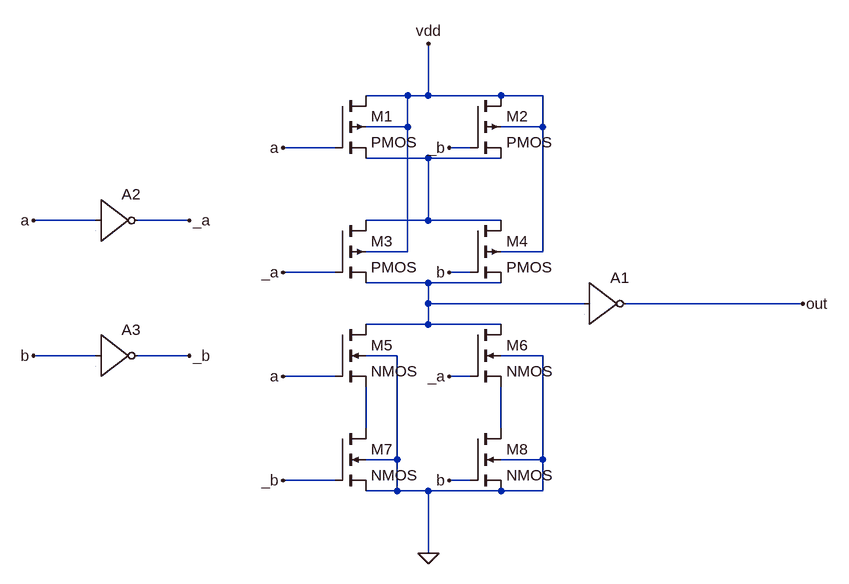
[diagram p0: schematic cmos_2input_xor_gate.asc]
cmos_2input_xor_gate.asc, the LTspice schematic file:
Version 4
SHEET 1 880 868
WIRE 192 112 128 112
WIRE 224 112 224 32
WIRE 224 112 192 112
WIRE 336 112 224 112
WIRE 400 112 336 112
WIRE 192 160 192 112
WIRE 192 160 128 160
WIRE 400 160 400 112
WIRE 400 160 336 160
WIRE 80 192 0 192
WIRE 288 192 256 192
WIRE 224 208 128 208
WIRE 336 208 224 208
WIRE -288 304 -384 304
WIRE -144 304 -224 304
WIRE 224 304 224 208
WIRE 224 304 128 304
WIRE 336 304 224 304
WIRE 192 352 192 160
WIRE 192 352 128 352
WIRE 400 352 400 160
WIRE 400 352 336 352
WIRE 80 384 0 384
WIRE 288 384 256 384
WIRE 224 400 128 400
WIRE 336 400 224 400
WIRE 224 432 224 400
WIRE 464 432 224 432
WIRE 800 432 528 432
WIRE 224 464 224 432
WIRE 224 464 128 464
WIRE 336 464 224 464
WIRE -288 512 -384 512
WIRE -144 512 -224 512
WIRE 176 512 128 512
WIRE 400 512 336 512
WIRE 80 544 0 544
WIRE 288 544 256 544
WIRE 128 624 128 560
WIRE 336 624 336 560
WIRE 176 672 176 512
WIRE 176 672 128 672
WIRE 400 672 400 512
WIRE 400 672 336 672
WIRE 80 704 0 704
WIRE 288 704 256 704
WIRE 176 720 176 672
WIRE 176 720 128 720
WIRE 224 720 176 720
WIRE 336 720 224 720
WIRE 400 720 400 672
WIRE 400 720 336 720
WIRE 224 816 224 720
FLAG 224 32 vdd
FLAG -384 304 a
FLAG -384 512 b
FLAG -144 304 _a
FLAG -144 512 _b
FLAG 0 192 a
FLAG 0 384 _a
FLAG 0 544 a
FLAG 256 544 _a
FLAG 0 704 _b
FLAG 256 704 b
FLAG 256 384 b
FLAG 256 192 _b
FLAG 224 816 0
FLAG 800 432 out
SYMBOL pmos4 80 112 R0
SYMATTR InstName M1
SYMBOL pmos4 288 112 R0
SYMATTR InstName M2
SYMBOL pmos4 80 304 R0
SYMATTR InstName M3
SYMBOL pmos4 288 304 R0
SYMATTR InstName M4
SYMBOL nmos4 80 464 R0
SYMATTR InstName M5
SYMBOL nmos4 288 464 R0
SYMATTR InstName M6
SYMBOL nmos4 80 624 R0
SYMATTR InstName M7
SYMBOL nmos4 288 624 R0
SYMATTR InstName M8
SYMBOL Digital\\inv 464 368 R0
SYMATTR InstName A1
SYMBOL Digital\\inv -288 240 R0
SYMATTR InstName A2
SYMBOL Digital\\inv -288 448 R0
SYMATTR InstName A3

The netlist it stands for:
* cmos_2input_xor_gate.asc
M1 vdd a N001 vdd PMOS
M2 vdd _b N001 vdd PMOS
M3 N001 _a N002 vdd PMOS
M4 N001 b N002 vdd PMOS
M5 N002 a N003 0 NMOS
M6 N002 _a N004 0 NMOS
M7 N003 _b 0 0 NMOS
M8 N004 b 0 0 NMOS
A1 N002 0 0 0 0 out 0 0 BUF
A2 a 0 0 0 0 _a 0 0 BUF
A3 b 0 0 0 0 _b 0 0 BUF
.model NMOS NMOS
.model PMOS PMOS
.lib standard.mos
.backanno
.end